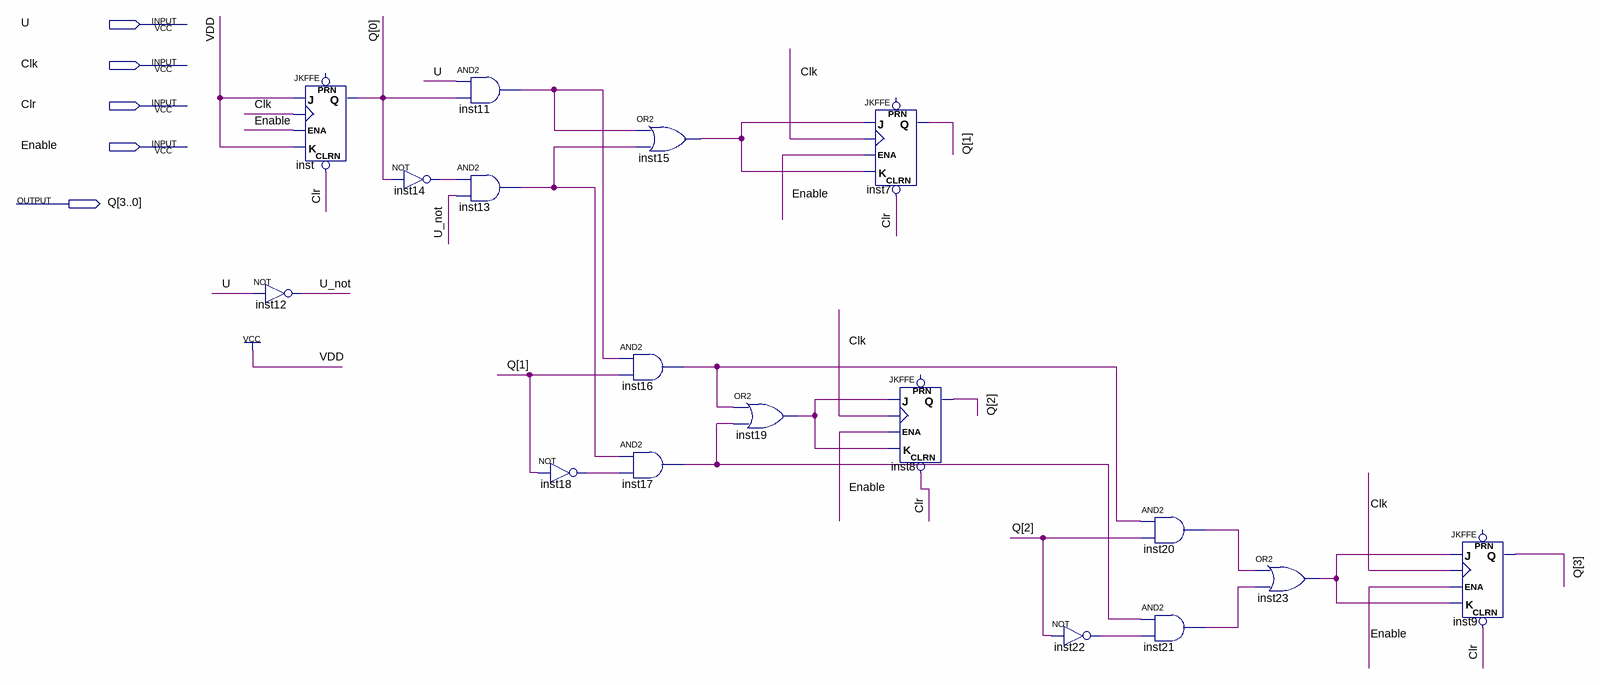
[diagram p0: schematic sheet]
// Quartus schematic Counter.bdf as structural Verilog: 17 symbols, 5 pins
module Counter (
  input  U,
  input  Clk,
  input  Clr,
  input  Enable,
  output [3:0] Q
);

  wire inst11_out, inst13_out, inst14_out, inst15_out, inst16_out, inst17_out, inst18_out, inst19_out,
       inst20_out, inst21_out, inst22_out, inst23_out, U_not;

  not inst12 (U_not, U);
  JKFFE inst (.J(1'b1), .CLK(Clk), .CLRN(Clr), .K(1'b1), .ENA(Enable), .Q(Q[0]));  // open: PRN
  not inst14 (inst14_out, Q[0]);
  and inst11 (inst11_out, U, Q[0]);
  and inst13 (inst13_out, inst14_out, U_not);
  not inst18 (inst18_out, Q[1]);
  or inst15 (inst15_out, inst11_out, inst13_out);
  and inst16 (inst16_out, inst11_out, Q[1]);
  and inst17 (inst17_out, inst13_out, inst18_out);
  or inst19 (inst19_out, inst16_out, inst17_out);
  JKFFE inst7 (.J(inst15_out), .CLK(Clk), .CLRN(Clr), .K(inst15_out), .ENA(Enable), .Q(Q[1]));  // open: PRN
  JKFFE inst8 (.J(inst19_out), .CLK(Clk), .CLRN(Clr), .K(inst19_out), .ENA(Enable), .Q(Q[2]));  // open: PRN
  not inst22 (inst22_out, Q[2]);
  and inst20 (inst20_out, inst16_out, Q[2]);
  and inst21 (inst21_out, inst17_out, inst22_out);
  or inst23 (inst23_out, inst20_out, inst21_out);
  JKFFE inst9 (.J(inst23_out), .CLK(Clk), .CLRN(Clr), .K(inst23_out), .ENA(Enable), .Q(Q[3]));  // open: PRN
endmodule
